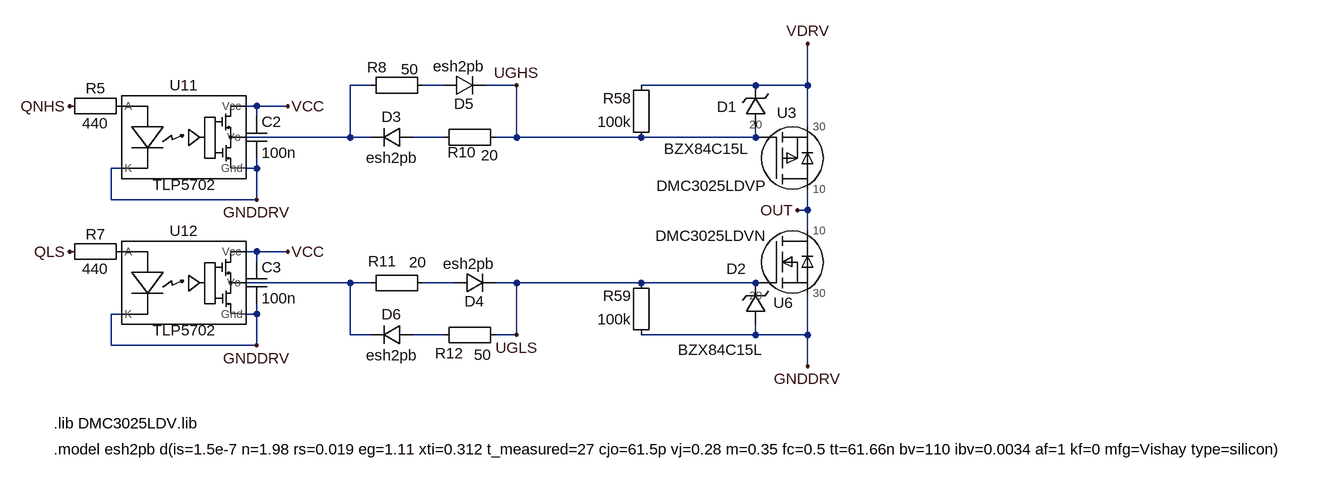
[diagram p0: schematic MosFetDriverBlock.asc]
MosFetDriverBlock.asc, the LTspice schematic file:
Version 4
SHEET 1 3880 2224
WIRE -1040 -224 -1072 -224
WIRE -928 -224 -960 -224
WIRE -816 -224 -864 -224
WIRE -448 -224 -624 -224
WIRE -368 -224 -368 -288
WIRE -368 -224 -448 -224
WIRE -1216 -192 -1232 -192
WIRE -1168 -192 -1216 -192
WIRE -1216 -176 -1216 -192
WIRE -368 -160 -368 -224
WIRE -1072 -144 -1072 -224
WIRE -1072 -144 -1232 -144
WIRE -1040 -144 -1072 -144
WIRE -928 -144 -976 -144
WIRE -816 -144 -816 -224
WIRE -816 -144 -848 -144
WIRE -624 -144 -816 -144
WIRE -448 -144 -448 -160
WIRE -448 -144 -624 -144
WIRE -1424 -96 -1440 -96
WIRE -1216 -96 -1216 -112
WIRE -1216 -96 -1232 -96
WIRE -1440 -48 -1440 -96
WIRE -1216 -48 -1216 -96
WIRE -1216 -48 -1440 -48
WIRE -368 -32 -368 -64
WIRE -368 -32 -384 -32
WIRE -368 0 -368 -32
WIRE -1216 32 -1232 32
WIRE -1168 32 -1216 32
WIRE -1216 48 -1216 32
WIRE -1072 80 -1232 80
WIRE -1040 80 -1072 80
WIRE -912 80 -960 80
WIRE -816 80 -848 80
WIRE -624 80 -816 80
WIRE -448 80 -624 80
WIRE -1424 128 -1440 128
WIRE -1216 128 -1216 112
WIRE -1216 128 -1232 128
WIRE -1072 160 -1072 80
WIRE -1040 160 -1072 160
WIRE -928 160 -976 160
WIRE -816 160 -816 80
WIRE -816 160 -848 160
WIRE -448 160 -448 144
WIRE -448 160 -624 160
WIRE -368 160 -368 96
WIRE -368 160 -448 160
WIRE -1440 176 -1440 128
WIRE -1216 176 -1216 128
WIRE -1216 176 -1440 176
WIRE -368 208 -368 160
FLAG -1168 -192 VCC
FLAG -1168 32 VCC
FLAG -368 -288 VDRV
FLAG -1504 -192 QNHS
FLAG -1504 32 QLS
FLAG -384 -32 OUT
FLAG -368 208 GNDDRV
FLAG -1216 -48 GNDDRV
FLAG -1216 176 GNDDRV
FLAG -816 -224 UGHS
FLAG -816 160 UGLS
SYMBOL Misc/EuropeanResistor -1520 -176 R270
WINDOW 0 28 56 VTop 2
WINDOW 3 5 56 VBottom 2
SYMATTR InstName R5
SYMATTR Value 440
SYMBOL Misc/EuropeanResistor -1520 48 R270
WINDOW 0 27 56 VTop 2
WINDOW 3 5 56 VBottom 2
SYMATTR InstName R7
SYMATTR Value 440
SYMBOL DMP3008SFGQ -400 -112 R0
WINDOW 0 0 -54 Bottom 2
WINDOW 3 -115 27 Top 2
SYMATTR InstName U3
SYMATTR Value DMC3025LDVP
SYMBOL DMN3018SFGQ -384 48 R0
WINDOW 0 -21 78 Bottom 2
WINDOW 3 -132 -56 Top 2
SYMATTR InstName U6
SYMATTR Value DMC3025LDVN
SYMBOL diode -976 -160 R90
WINDOW 0 0 32 VBottom 2
WINDOW 3 32 32 VTop 2
SYMATTR InstName D3
SYMATTR Value esh2pb
SYMBOL TLP5702 -1328 -144 R0
SYMATTR InstName U11
SYMBOL TLP5702 -1328 80 R0
SYMATTR InstName U12
SYMBOL Misc/EuropeanResistor -944 -240 R90
WINDOW 0 4 87 VBottom 2
WINDOW 3 -24 36 VTop 2
SYMATTR InstName R8
SYMATTR Value 50
SYMBOL Misc/EuropeanResistor -832 -160 R90
WINDOW 0 55 68 VBottom 2
WINDOW 3 28 25 VTop 2
SYMATTR InstName R10
SYMATTR Value 20
SYMBOL diode -912 96 R270
WINDOW 0 -28 31 VTop 2
WINDOW 3 61 23 VBottom 2
SYMATTR InstName D4
SYMATTR Value esh2pb
SYMBOL Misc/EuropeanResistor -944 64 R90
WINDOW 0 -2 78 VBottom 2
WINDOW 3 -31 24 VTop 2
SYMATTR InstName R11
SYMATTR Value 20
SYMBOL Misc/EuropeanResistor -832 144 R90
WINDOW 0 60 87 VBottom 2
WINDOW 3 31 36 VTop 2
SYMATTR InstName R12
SYMATTR Value 50
SYMBOL cap -1232 -176 R0
SYMATTR InstName C2
SYMATTR Value 100n
SYMBOL cap -1232 48 R0
SYMATTR InstName C3
SYMATTR Value 100n
SYMBOL Misc/EuropeanResistor -608 -128 R180
WINDOW 0 31 76 Left 2
WINDOW 3 31 40 Left 2
SYMATTR InstName R58
SYMATTR Value 100k
SYMBOL Misc/EuropeanResistor -608 176 R180
WINDOW 0 31 76 Left 2
WINDOW 3 31 40 Left 2
SYMATTR InstName R59
SYMATTR Value 100k
SYMBOL zener -432 -160 R180
WINDOW 0 45 31 Left 2
WINDOW 3 26 -34 Left 2
SYMATTR InstName D1
SYMATTR Value BZX84C15L
SYMBOL zener -432 144 R180
WINDOW 0 30 86 Left 2
WINDOW 3 4 -39 Left 2
SYMATTR InstName D2
SYMATTR Value BZX84C15L
SYMBOL diode -928 -208 R270
WINDOW 0 -28 31 VTop 2
WINDOW 3 61 23 VBottom 2
SYMATTR InstName D5
SYMATTR Value esh2pb
SYMBOL diode -976 144 R90
WINDOW 0 0 32 VBottom 2
WINDOW 3 32 32 VTop 2
SYMATTR InstName D6
SYMATTR Value esh2pb
TEXT -1528 296 Left 2 !.lib DMC3025LDV.lib
TEXT -1528 336 Left 2 !.model esh2pb d(is=1.5e-7 n=1.98 rs=0.019 eg=1.11 xti=0.312 t_measured=27 cjo=61.5p vj=0.28 m=0.35 fc=0.5 tt=61.66n bv=110 ibv=0.0034 af=1 kf=0 mfg=Vishay type=silicon)

The netlist it stands for:
* MosFetDriverBlock.asc
R5 QNHS P001 440
R7 QLS P002 440
XU3 OUT UGHS VDRV DMC3025LDVP  ; pins 10 20 30
XU6 OUT UGLS GNDDRV DMC3025LDVN  ; pins 10 20 30
D3 N003 N001 esh2pb
XU11 P001 GNDDRV GNDDRV N001 VCC TLP5702 TLP5702  ; pins A K Gnd Vo Vcc
XU12 P002 GNDDRV GNDDRV N004 VCC TLP5702 TLP5702  ; pins A K Gnd Vo Vcc
R8 N002 N001 50
R10 UGHS N003 20
D4 N005 UGLS esh2pb
R11 N005 N004 20
R12 UGLS N006 50
C2 VCC GNDDRV 100n
C3 VCC GNDDRV 100n
R58 UGHS VDRV 100k
R59 GNDDRV UGLS 100k
D1 UGHS VDRV BZX84C15L
D2 GNDDRV UGLS BZX84C15L
D5 N002 UGHS esh2pb
D6 N006 N004 esh2pb
.model D D
.lib standard.dio
.lib DMC3025LDV.lib
.model esh2pb d(is=1.5e-7 n=1.98 rs=0.019 eg=1.11 xti=0.312 t_measured=27 cjo=61.5p vj=0.28 m=0.35 fc=0.5 tt=61.66n bv=110 ibv=0.0034 af=1 kf=0 mfg=Vishay type=silicon)
.lib DMP3008SFGQ.lib
.lib DMN3018SFGQ.lib
.lib TLP5702.mod
.backanno
.end